# EasyEDA Pro project 小车PCB.epro

# Schematic Schematic1
Assembly Variant: Basic; Board Name: Board1; Create Date: 2026-04-20; Page Name: P1; Project Name: TI扩展板1; Schematic Name: Schematic1; Update Date: 2026-04-20; Company: 嘉立创EDA; Page Size: A4; Version: V1.0
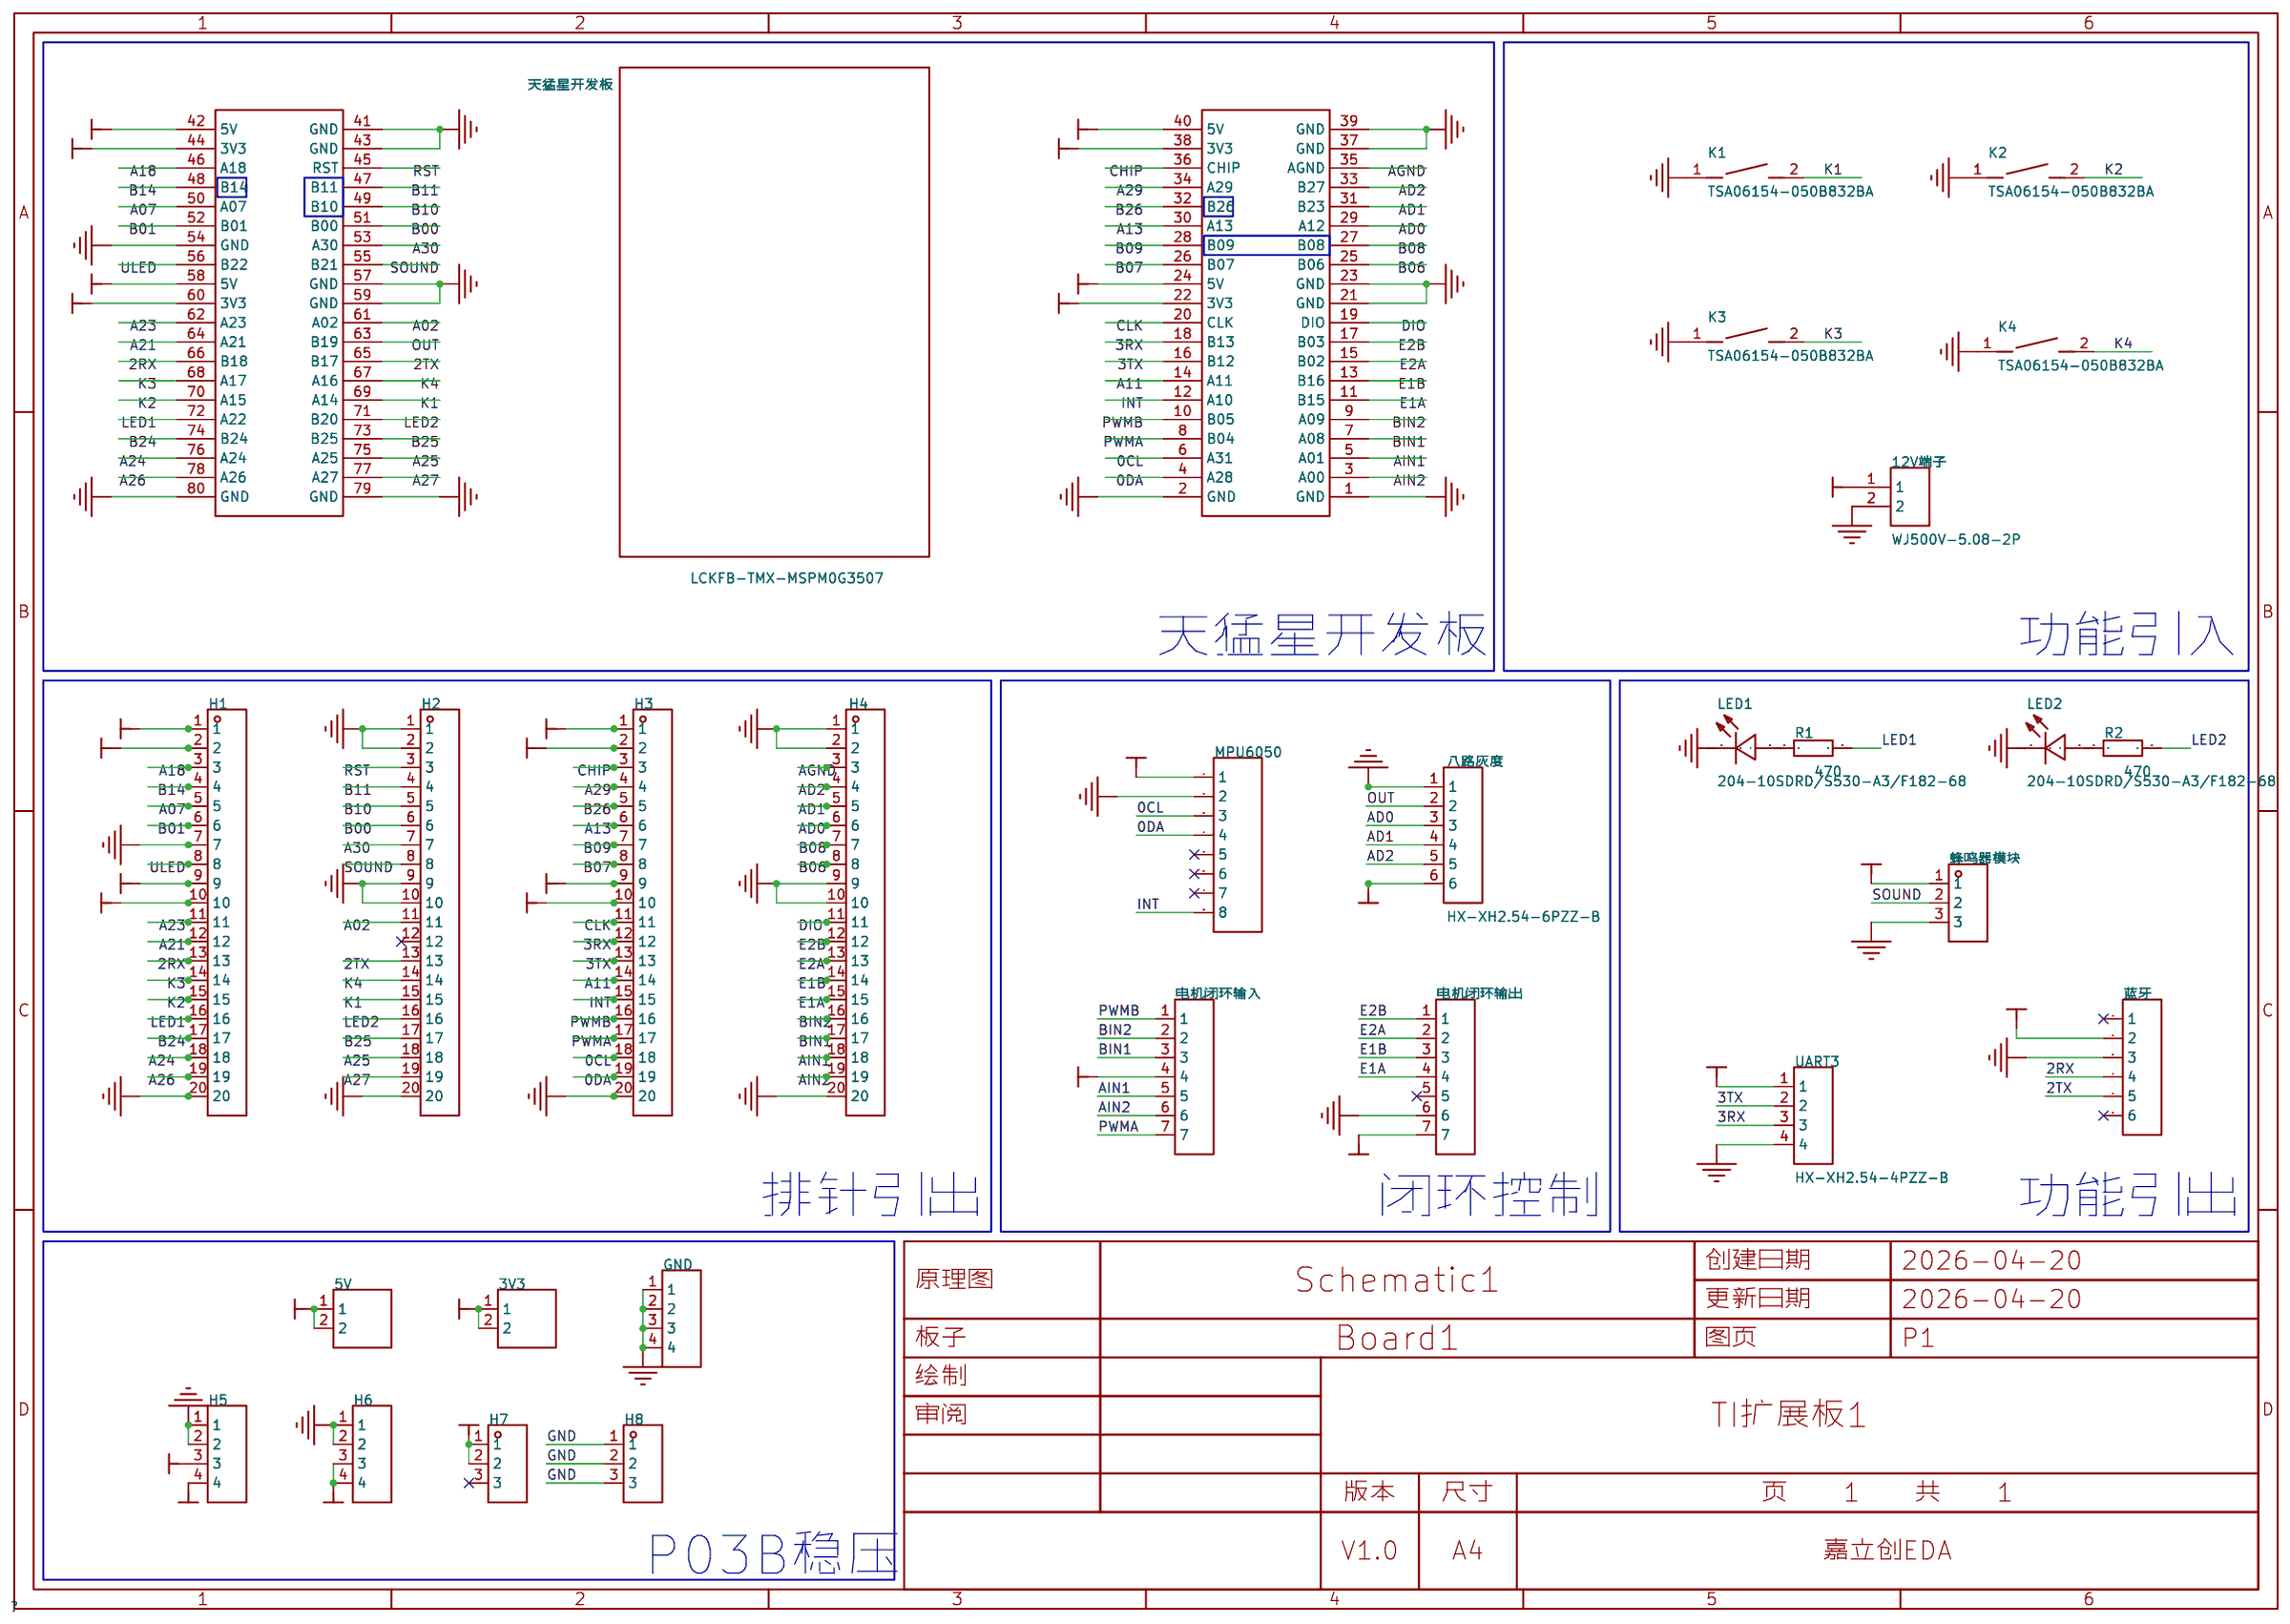
[diagram p0: schematic sheet]

## Parts
3V3  -  [HDR-TH_2P-P2.54-V-M-1]
5V  -  [HDR-TH_2P-P2.54-V-M-1]
12V端子  WJ500V-5.08-2P  [CONN-TH_2P-P5.00_WJ500V-5.08-2P]
GND  -  [HDR-TH_4P-P2.54-V-M]
H1  -  [HDR-TH_20P-P2.54-V-M-1]
H2  -  [HDR-TH_20P-P2.54-V-M-1]
H3  -  [HDR-TH_20P-P2.54-V-M-1]
H4  -  [HDR-TH_20P-P2.54-V-M-1]
H5  -  [HDR-TH_4P-P2.54-V-M]
H6  -  [HDR-TH_4P-P2.54-V-M]
H7  -  [HDR-TH_3P-P2.54-V-M]
H8  -  [HDR-TH_3P-P2.54-V-M]
K1  TSA06154-050B832BA  [SW-TH_L6.1-W6.1-P5.00]
K2  TSA06154-050B832BA  [SW-TH_L6.1-W6.1-P5.00]
K3  TSA06154-050B832BA  [SW-TH_L6.1-W6.1-P5.00]
K4  TSA06154-050B832BA  [SW-TH_L6.1-W6.1-P5.00]
LED1  204-10SDRD/S530-A3/F182-68  [LED-TH_BD4.0-P2.50-RD]
LED2  204-10SDRD/S530-A3/F182-68  [LED-TH_BD4.0-P2.50-RD]
MPU6050  -  [HDR-TH_8P-P2.54-V-M]
R1  470  [R0805]
R2  470  [R0805]
UART3  HX-XH2.54-4PZZ-B  [CONN-TH_4P-P2.5-HX-XH2.54-4PZZ-B]
八路灰度  HX-XH2.54-6PZZ-B  [CONN-TH_6P-P2.5-HX-XH2.54-6PZZ-B]
天猛星开发板  LCKFB-TMX-MSPM0G3507  [COMM-TH_LCKFB-TMX-MSPM0G3507]
电机闭环输入  -  [HDR-TH_7P-P2.54-V-M]
电机闭环输出  -  [HDR-TH_7P-P2.54-V-M]
蓝牙  -  [HDR-TH_6P-P2.54-V-M-1]
蜂鸣器模块  -  [HDR-TH_3P-P2.54-V-M]

## Library data of the parts
3V3 5V = HDR-M_2.54_1x2P: Supplier Part: C124375; Supplier Footprint: 插件
12V端子 = WJ500V-5.08-2P: 结构:1x2P;间距:5.08mm;颜色:绿色;安装方式:直插;额定电流:18A;额定电压:250V;排数:1;线规 - AWG:14~30;线规 - 平方毫米:2.5;每排PIN数:2;触头材质:-;触头镀层:-;工作温度范围:-40℃~+105℃;焊接温度(最大值):-;; LCSC Part Name: 1x2P 5.08mm 直插 排数:1 每排P数:2; Supplier Part: C8465; Manufacturer: KANGNEX(康奈克斯电气); Supplier Footprint: 插件,P=5.08mm; JLCPCB Part Class: Extended Part; Datasheet: https://atta.szlcsc.com/upload/public/pdf/source/20191225/C8465_02D34CE5B5B4A53DF5891601D97FA9F4.pdf; Supplier: LCSC; Structure: 1x2P; Pitch: 5.08mm; Color: 绿色; Mounting Style: 直插; Current Rating (Max): 18A; Voltage Rating (Max): 250V; Number of Pins: 2P; Number of Rows: 1; Wire Gauge - AWG: 14~30; Wire Gauge - mm2: 2.5; Number of PINs Per Row: 2; Operating Temperature Range: -40℃~+105℃; Screw Specification: M2.5
GND H5 H6 = HDR-M_2.54_1x4P: Supplier Part: C492403; Supplier Footprint: 插件
H1-H4 = HDR-M_2.54_1x20P: 间距:2.54mm;总PIN位数:20;排数:1;插针结构:-;行距:-;安装类型:直插;圆针/方针:-;额定电流:-;额定电压:-;配合针长度:-;塑高:-;触头材质:黄铜;触头镀层:-;颜色:黑色;; Supplier Part: C50981; Supplier Footprint: 插件
H7 H8 蜂鸣器模块 = HDR-M_2.54_1x3P: Supplier Part: C2937625; Supplier Footprint: 插件
K1-K4 = TSA06154-050B832BA: 6*6*5插件轻触开关、短两脚、脚长3.6mm、250gf、Fe盖、PA66黑柄; LCSC Part Name: 6*6*5短两脚轻触开关250gf; Supplier Part: C49174414; Manufacturer: Khon(康宏电子); Supplier Footprint: 插件,6.1x6.1mm; JLCPCB Part Class: Extended Part; Datasheet: https://item.szlcsc.com/datasheet/TSA06154-050B832BA/51568440.html; Supplier: LCSC
LED1 LED2 = 204-10SDRD/S530-A3/F182-68: Supplier Part: C473831; Manufacturer: EVERLIGHT(亿光); Supplier Footprint: 插件; JLCPCB Part Class: Extended Part; Supplier: LCSC
MPU6050 = HDR-M_2.54_1x8P: Supplier Part: C124381; Supplier Footprint: 插件
R1 R2 = Res_0805: Supplier Footprint: 0805
UART3 = HX-XH2.54-4PZZ-B: 插针结构:1x4P;间距:2.54mm;安装方式:直插;参考系列:XH;总PIN数:4P;排数:1;每排PIN数:4;行距:-;额定电流:3A;触头材质:黄铜;触头镀层:锡;工作温度:-25℃~+85℃;; LCSC Part Name: 1x4P 间距:2.54mm 直插 系列:XH; Supplier Part: C49010020; Manufacturer: hanxia(韩下); Supplier Footprint: 插件,P=2.5mm; JLCPCB Part Class: Extended Part; Datasheet: https://item.szlcsc.com/datasheet/HX-XH2.54-4PZZ-B/51365941.html; Supplier: LCSC; Pins Structure: 1x4P; Pitch: 2.54mm; Mounting Type: 直插; Reference Series: XH; Number of Pins: 4P; Number of Rows: 1; Number of PINs Per Row: 4; Current Rating: 3A; Contact Material: 黄铜; Contact Plating: 锡; Operating Temperature: -25℃~+85℃; Voltage Rating: 250V; Plastic Material: PA66; Flame Retardant Rating: UL94V-0; Color: 黑色
八路灰度 = HX-XH2.54-6PZZ-B: 插针结构:1x6P;间距:2.54mm;安装方式:直插;参考系列:XH;总PIN数:6P;排数:1;每排PIN数:6;行距:-;额定电流:3A;触头材质:黄铜;触头镀层:锡;工作温度:-25℃~+85℃;; LCSC Part Name: 1x6P 间距:2.54mm 直插 系列:XH; Supplier Part: C49010022; Manufacturer: hanxia(韩下); Supplier Footprint: 插件,P=2.5mm; JLCPCB Part Class: Extended Part; Datasheet: https://item.szlcsc.com/datasheet/HX-XH2.54-6PZZ-B/51365943.html; Supplier: LCSC; Pins Structure: 1x6P; Pitch: 2.54mm; Mounting Type: 直插; Reference Series: XH; Number of Pins: 6P; Number of Rows: 1; Number of PINs Per Row: 6; Current Rating: 3A; Contact Material: 黄铜; Contact Plating: 锡; Operating Temperature: -25℃~+85℃; Voltage Rating: 250V; Plastic Material: PA66; Flame Retardant Rating: UL94V-0; Color: 黑色
天猛星开发板 = LCKFB-TMX-MSPM0G3507: 该开发板板载德州仪器的微控制器核心,完美适配电赛指定TI芯片题目的要求。支持Keil、CCS和IAU等环境开发,搭配图形化代码生成工具,无需在意底层驱动,助力快速开发。硬件上带有多电源保护,防反接/防过流/受电压,和三路参考电压选择,降低电衰试错成本。80P引脚的引出方便扩展,提供完善的入门手册和模块移植案例。; LCSC Part Name: 5件套 立创·天猛星MSPM0G3507开发板; Supplier Part: C42378531; Manufacturer: 立创开发板; JLCPCB Part Class: Extended Part; Datasheet: https://item.szlcsc.com/datasheet/LCKFB-TMX-MSPM0G3507/44281600.html; Supplier: LCSC
电机闭环输入 电机闭环输出 = HDR-M_2.54_1x7P: Supplier Part: C492406; Supplier Footprint: 插件
蓝牙 = HDR-M_2.54_1x6P: Supplier Part: C37208; Supplier Footprint: 插件

## Nets
3V3: 3V3.1 3V3.2 H6.3 H6.4
5V: 5V.1 5V.2 H5.3
12V: 12V端子.1 H7.1 H7.2
+5V: H1.1 H1.9 H3.1 H3.9 H5.4 UART3.1 八路灰度.6 天猛星开发板.24(5V) 天猛星开发板.40(5V) 天猛星开发板.42(5V) 天猛星开发板.58(5V) 电机闭环输出.7 蜂鸣器模块.1
AGND: H4.3 天猛星开发板.35(AGND)
GND: 12V端子.2 GND.1 GND.2 GND.3 GND.4 H1.7 H1.20 H2.1 H2.2 H2.9 H2.10 H2.20 H3.20 H4.1 H4.2 H4.9 H4.10 H4.20 H5.1 H5.2 H6.1 H6.2 H8.1 H8.2 H8.3 K1.1 K2.1 K3.1 K4.1 LED1.1(C) LED2.1(C) MPU6050.2 UART3.4 八路灰度.1 天猛星开发板.1(GND) 天猛星开发板.2(GND) 天猛星开发板.21(GND) 天猛星开发板.23(GND) 天猛星开发板.37(GND) 天猛星开发板.39(GND) 天猛星开发板.41(GND) 天猛星开发板.43(GND) 天猛星开发板.54(GND) 天猛星开发板.57(GND) 天猛星开发板.59(GND) 天猛星开发板.79(GND) 天猛星开发板.80(GND) 电机闭环输出.6 蓝牙.3 蜂鸣器模块.3
VCC: H1.2 H1.10 H3.2 H3.10 MPU6050.1 天猛星开发板.22(3V3) 天猛星开发板.38(3V3) 天猛星开发板.44(3V3) 天猛星开发板.60(3V3) 电机闭环输入.4 蓝牙.2
0CL: H3.18 MPU6050.3 天猛星开发板.6(A31)
0DA: H3.19 MPU6050.4 天猛星开发板.4(A28)
2RX: H1.13 天猛星开发板.66(B18) 蓝牙.4
2TX: H2.13 天猛星开发板.65(B17) 蓝牙.5
3RX: H3.12 UART3.3 天猛星开发板.18(B13)
3TX: H3.13 UART3.2 天猛星开发板.16(B12)
A02: H2.11 天猛星开发板.61(A02)
A07: H1.5 天猛星开发板.50(A07)
A11: H3.14 天猛星开发板.14(A11)
A13: H3.6 天猛星开发板.30(A13)
A18: H1.3 天猛星开发板.46(A18)
A21: H1.12 天猛星开发板.64(A21)
A23: H1.11 天猛星开发板.62(A23)
A24: H1.18 天猛星开发板.76(A24)
A25: H2.18 天猛星开发板.75(A25)
A26: H1.19 天猛星开发板.78(A26)
A27: H2.19 天猛星开发板.77(A27)
A29: H3.4 天猛星开发板.34(A29)
A30: H2.7 天猛星开发板.53(A30)
AD0: H4.6 八路灰度.3 天猛星开发板.29(A12)
AD1: H4.5 八路灰度.4 天猛星开发板.31(B23)
AD2: H4.4 八路灰度.5 天猛星开发板.33(B27)
AIN1: H4.18 天猛星开发板.5(A01) 电机闭环输入.5
AIN2: H4.19 天猛星开发板.3(A00) 电机闭环输入.6
B00: H2.6 天猛星开发板.51(B00)
B01: H1.6 天猛星开发板.52(B01)
B06: H4.8 天猛星开发板.25(B06)
B07: H3.8 天猛星开发板.26(B07)
B08: H4.7 天猛星开发板.27(B08)
B09: H3.7 天猛星开发板.28(B09)
B10: H2.5 天猛星开发板.49(B10)
B11: H2.4 天猛星开发板.47(B11)
B14: H1.4 天猛星开发板.48(B14)
B24: H1.17 天猛星开发板.74(B24)
B25: H2.17 天猛星开发板.73(B25)
B26: H3.5 天猛星开发板.32(B26)
BIN1: H4.17 天猛星开发板.7(A08) 电机闭环输入.3
BIN2: H4.16 天猛星开发板.9(A09) 电机闭环输入.2
CHIP: H3.3 天猛星开发板.36(CHIP)
CLK: H3.11 天猛星开发板.20(CLK)
DIO: H4.11 天猛星开发板.19(DIO)
E1A: H4.15 天猛星开发板.11(B15) 电机闭环输出.4
E1B: H4.14 天猛星开发板.13(B16) 电机闭环输出.3
E2A: H4.13 天猛星开发板.15(B02) 电机闭环输出.2
E2B: H4.12 天猛星开发板.17(B03) 电机闭环输出.1
INT: H3.15 MPU6050.8 天猛星开发板.12(A10)
K1: H2.15 K1.2 天猛星开发板.69(A14)
K2: H1.15 K2.2 天猛星开发板.70(A15)
K3: H1.14 K3.2 天猛星开发板.68(A17)
K4: H2.14 K4.2 天猛星开发板.67(A16)
LED1: H1.16 R1.2 天猛星开发板.72(A22)
LED2: H2.16 R2.2 天猛星开发板.71(B20)
OUT: 八路灰度.2 天猛星开发板.63(B19)
PWMA: H3.17 天猛星开发板.8(B04) 电机闭环输入.7
PWMB: H3.16 天猛星开发板.10(B05) 电机闭环输入.1
RST: H2.3 天猛星开发板.45(RST)
SOUND: H2.8 天猛星开发板.55(B21) 蜂鸣器模块.2
ULED: H1.8 天猛星开发板.56(B22)
$1N365: LED2.2(A) R2.1
$1N366: LED1.2(A) R1.1

Not connected (* = marked no-connect by the designer): H2 12*; H7 3*; MPU6050 5* 6* 7*; 电机闭环输出 5*; 蓝牙 1* 6*

## Notes on the sheet
- 天猛星开发板
- 功能引入
- 排针引出
- 闭环控制
- 功能引出
- P03B稳压

# Board PCB1
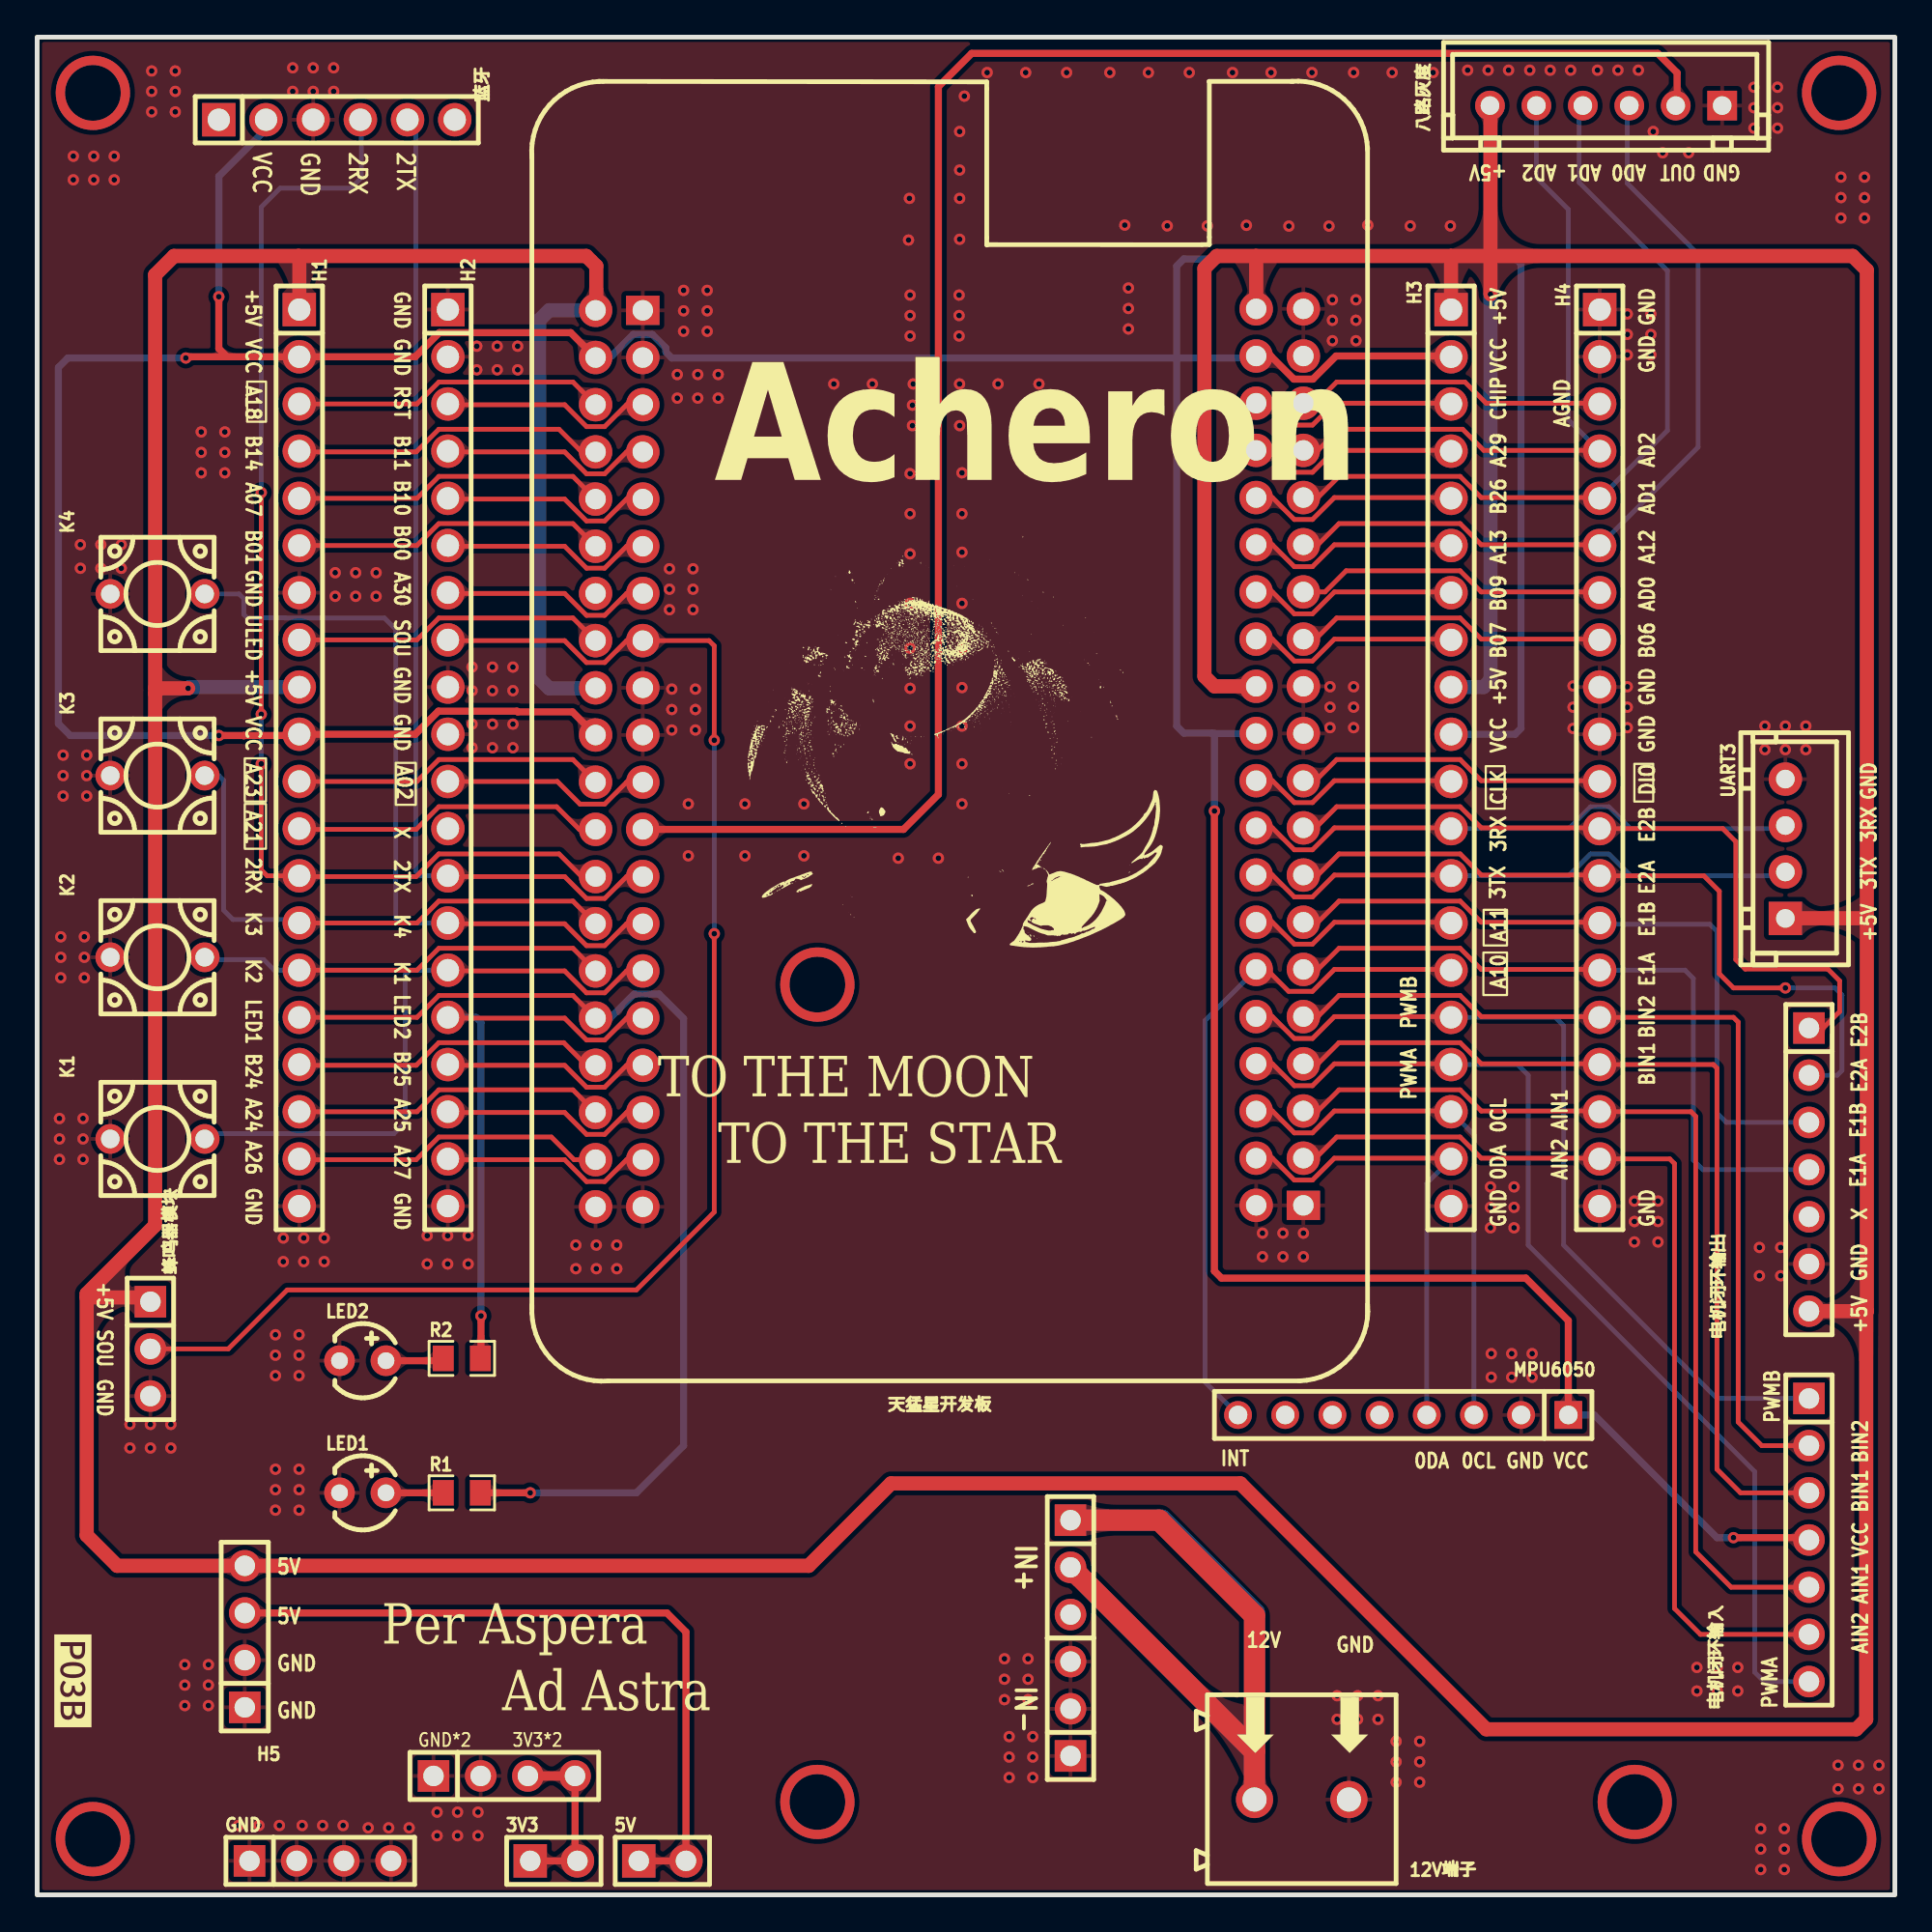
[diagram p1: board, top side]
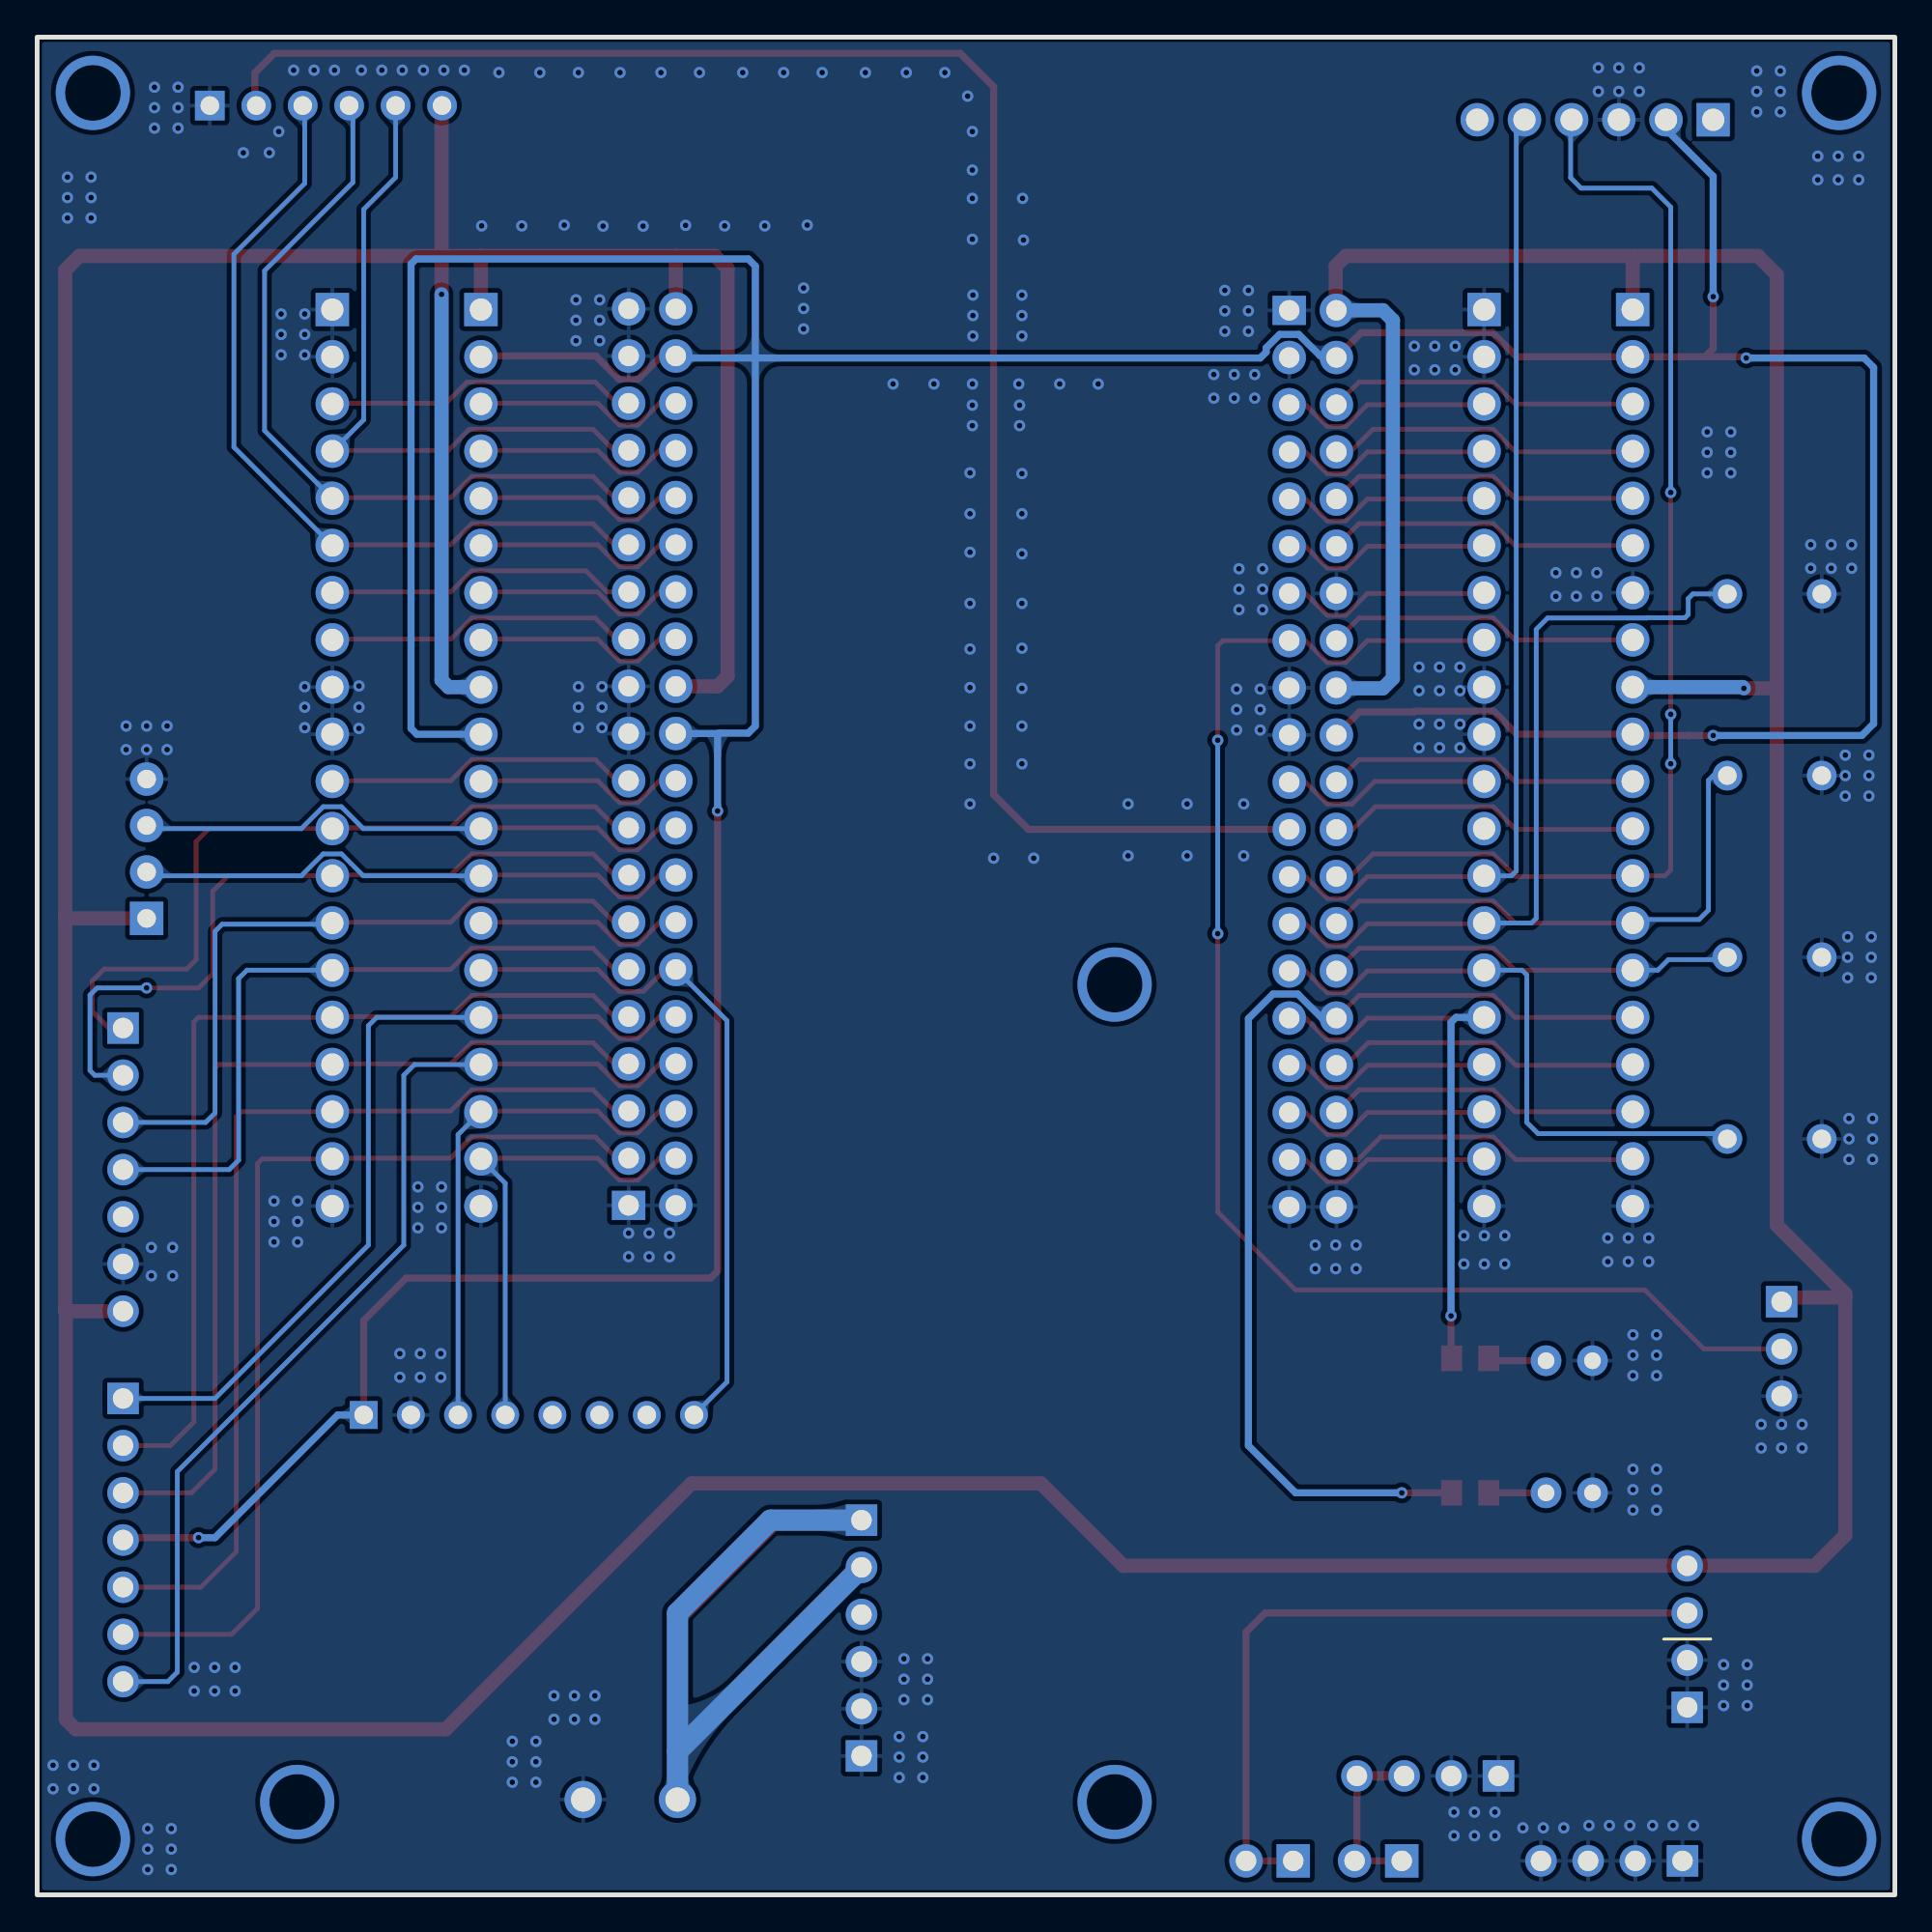
[diagram p2: board, bottom side, seen from below]

Outline 100 x 100 mm; copper layers: Top Layer, Bottom Layer. Coordinates in mm from the lower left corner of the outline.
Outline path: rectangle 0,100 100,0
Stack: Top Layer 0.035mm / Dielectric1 1.51mm FR4 er 4.5 / Bottom Layer 0.035mm

## Design rules (mm)
spacing copperThickness1oz (default): track to track 0.102, other pairs 0.152 to 0.3
spacing copperThickness2oz: track to track 0.203, other pairs 0.152 to 0.3
track width copperThickness1oz (default): min 0.127, default 0.254, max 2.54
track width copperThickness2oz: min 0.203, default 0.254, max 2.54
differential pair differentialPair (default): width min 0.127, default 0.254, max 2.54; gap min 0.152, default 0.152
net GND uses copperRegion

## Placement (name value [footprint] x y rotation side)
3V3  -  [HDR-TH_2P-P2.54-V-M-1]  27.81 1.83 0 top
5V  -  [HDR-TH_2P-P2.54-V-M-1]  33.66 1.83 0 top
12V端子  WJ500V-5.08-2P  [CONN-TH_2P-P5.00_WJ500V-5.08-2P]  68.07 5.13 0 top
GND  -  [HDR-TH_4P-P2.54-V-M]  15.24 1.83 0 top
H1  -  [HDR-TH_20P-P2.54-V-M-1]  14.11 61.2 270 top
H2  -  [HDR-TH_20P-P2.54-V-M-1]  22.11 61.2 270 top
H3  -  [HDR-TH_20P-P2.54-V-M-1]  76.11 61.2 270 top
H4  -  [HDR-TH_20P-P2.54-V-M-1]  84.11 61.21 270 top
H5  -  [HDR-TH_4P-P2.54-V-M]  11.18 13.9 90 top
H6  -  [HDR-TH_4P-P2.54-V-M]  25.15 6.4 0 top
H7  -  [HDR-TH_3P-P2.54-V-M]  55.63 17.63 270 top
H8  -  [HDR-TH_3P-P2.54-V-M]  55.63 10.02 90 top
K1  TSA06154-050B832BA  [SW-TH_L6.1-W6.1-P5.00]  6.48 40.69 0 top
K2  TSA06154-050B832BA  [SW-TH_L6.1-W6.1-P5.00]  6.48 50.47 0 top
K3  TSA06154-050B832BA  [SW-TH_L6.1-W6.1-P5.00]  6.48 60.25 0 top
K4  TSA06154-050B832BA  [SW-TH_L6.1-W6.1-P5.00]  6.48 70.03 0 top
LED1  204-10SDRD/S530-A3/F182-68  [LED-TH_BD4.0-P2.50-RD]  17.53 21.64 0 top
LED2  204-10SDRD/S530-A3/F182-68  [LED-TH_BD4.0-P2.50-RD]  17.53 28.75 0 top
MPU6050  -  [HDR-TH_8P-P2.54-V-M]  73.53 25.83 180 top
R1  470  [R0805]  22.86 21.64 0 top
R2  470  [R0805]  22.86 28.88 0 top
UART3  HX-XH2.54-4PZZ-B  [CONN-TH_4P-P2.5-HX-XH2.54-4PZZ-B]  94.11 56.31 270 top
八路灰度  HX-XH2.54-6PZZ-B  [CONN-TH_6P-P2.5-HX-XH2.54-6PZZ-B]  84.46 96.32 0 top
天猛星开发板  LCKFB-TMX-MSPM0G3507  [COMM-TH_LCKFB-TMX-MSPM0G3507]  49.11 61.2 180 top
电机闭环输入  -  [HDR-TH_7P-P2.54-V-M]  95.38 19.1 270 top
电机闭环输出  -  [HDR-TH_7P-P2.54-V-M]  95.38 39.04 270 top
蓝牙  -  [HDR-TH_6P-P2.54-V-M-1]  16.13 95.56 0 top
蜂鸣器模块  -  [HDR-TH_3P-P2.54-V-M]  6.1 29.39 270 top

## Footprints (pads in the part's own frame, mm; a bottom-side part is the same pattern mirrored in y, then rotated)
COMM-TH_LCKFB-TMX-MSPM0G3507
  rect 1.8x1.575 hole 1.1: 1(-19.05,24.09) 41(16.51,-24.09)
  round 1.8 hole 1.1: 2(-16.51,24.09) 3(-19.05,21.549) 4(-16.51,21.549) 5(-19.05,19.009) 6(-16.51,19.009) 7(-19.05,16.47) 8(-16.51,16.47) 9(-19.05,13.93) 10(-16.51,13.93) 11(-19.05,11.389) 12(-16.51,11.389) 13(-19.05,8.85) 14(-16.51,8.85) 15(-19.05,6.309) 16(-16.51,6.309) 17(-19.05,3.769) 18(-16.51,3.769) 19(-19.05,1.23) 20(-16.51,1.23) 21(-19.05,-1.31) 22(-16.51,-1.31) 23(-19.05,-3.85) 24(-16.51,-3.85) 25(-19.05,-6.391) 26(-16.51,-6.391) 27(-19.05,-8.931) 28(-16.51,-8.931) 29(-19.05,-11.47) 30(-16.51,-11.47) 31(-19.05,-14.011) 32(-16.51,-14.011) 33(-19.05,-16.55) 34(-16.51,-16.55) 35(-19.05,-19.09) 36(-16.51,-19.09) 37(-19.05,-21.631) 38(-16.51,-21.631) 39(-19.05,-24.171) 40(-16.51,-24.171) 42(19.05,-24.09) 43(16.51,-21.549) 44(19.05,-21.549) 45(16.51,-19.009) 46(19.05,-19.009) 47(16.51,-16.47) 48(19.05,-16.47) 49(16.51,-13.93) 50(19.05,-13.93) 51(16.51,-11.389) 52(19.05,-11.389) 53(16.51,-8.85) 54(19.05,-8.85) 55(16.51,-6.309) 56(19.05,-6.309) 57(16.51,-3.769) 58(19.05,-3.769) 59(16.51,-1.23) 60(19.05,-1.23) 61(16.51,1.31) 62(19.05,1.31) 63(16.51,3.85) 64(19.05,3.85) 65(16.51,6.391) 66(19.05,6.391) 67(16.51,8.931) 68(19.05,8.931) 69(16.51,11.47) 70(19.05,11.47) 71(16.51,14.011) 72(19.05,14.011) 73(16.51,16.55) 74(19.05,16.55) 75(16.51,19.09) 76(19.05,19.09) 77(16.51,21.631) 78(19.05,21.631) 79(16.51,24.171) 80(19.05,24.171)
CONN-TH_2P-P5.00_WJ500V-5.08-2P
  round 2 hole 1.3: 1(-2.54,0) 2(2.54,0)
CONN-TH_4P-P2.5-HX-XH2.54-4PZZ-B
  rect 1.8x1.8 hole 1: 1(3.75,0)
  round 1.8 hole 1: 2(1.25,0) 3(-1.25,0) 4(-3.75,0)
CONN-TH_6P-P2.5-HX-XH2.54-6PZZ-B
  rect 1.6x1.6 hole 1: 1(6.25,0)
  round 1.6 hole 1: 2(3.75,0) 3(1.25,0) 4(-1.25,0) 5(-3.75,0) 6(-6.25,0)
HDR-TH_2P-P2.54-V-M-1
  rect 1.8x1.8 hole 1.1: 1(-1.27,0)
  round 1.8 hole 1.1: 2(1.27,0)
HDR-TH_3P-P2.54-V-M
  rect 1.7x1.7 hole 1.1: 1(-2.54,0)
  round 1.7 hole 1.1: 2(0,0) 3(2.54,0)
HDR-TH_4P-P2.54-V-M
  rect 1.7x1.7 hole 1.1: 1(-3.81,0)
  round 1.7 hole 1.1: 2(-1.27,0) 3(1.27,0) 4(3.81,0)
HDR-TH_6P-P2.54-V-M-1
  rect 1.8x1.8 hole 1.2: 1(-6.35,0)
  round 1.8 hole 1.2: 2(-3.81,0) 3(-1.27,0) 4(1.27,0) 5(3.81,0) 6(6.35,0)
HDR-TH_7P-P2.54-V-M
  rect 1.7x1.7 hole 1.1: 1(-7.62,0)
  round 1.7 hole 1.1: 2(-5.08,0) 3(-2.54,0) 4(0,0) 5(2.54,0) 6(5.08,0) 7(7.62,0)
HDR-TH_8P-P2.54-V-M
  rect 1.5x1.5 hole 1: 1(-8.89,0)
  round 1.5 hole 1: 2(-6.35,0) 3(-3.81,0) 4(-1.27,0) 5(1.27,0) 6(3.81,0) 7(6.35,0) 8(8.89,0)
HDR-TH_20P-P2.54-V-M-1
  rect 1.8x1.8 hole 1.2: 1(-24.13,0)
  round 1.8 hole 1.2: 2(-21.59,0) 3(-19.05,0) 4(-16.51,0) 5(-13.97,0) 6(-11.43,0) 7(-8.89,0) 8(-6.35,0) 9(-3.81,0) 10(-1.27,0) 11(1.27,0) 12(3.81,0) 13(6.35,0) 14(8.89,0) 15(11.43,0) 16(13.97,0) 17(16.51,0) 18(19.05,0) 19(21.59,0) 20(24.13,0)
LED-TH_BD4.0-P2.50-RD
  round 1.651 hole 0.9: 1(-1.25,0) 2(1.25,0)
R0805
  rect 1.133x1.377 smd: 1(-1,0) 2(1,0)
SW-TH_L6.1-W6.1-P5.00
  round 1.6 hole 1: 1(-2.54,0) 2(2.54,0)

## Nets
As in the schematic.

Pads without a net: H2 12; H7 3; MPU6050 5 6 7; 电机闭环输出 5; 蓝牙 1 6

## Via types
v1: diameter 4, hole 3, Top Layer to Bottom Layer, 7 vias
v2: diameter 0.61, hole 0.305, Top Layer to Bottom Layer, 364 vias

## Routing (per net, layer and track width the routed paths; a pad name or vN(x,y) marks a point on that pad's centre or on a via; arc(x,y) is an arc through that point)
3V3: length 9.9
  Top Layer w0.381: 3V3.1 3V3.2 28.96,1.96 H6.4 ; 28.45,1.83 28.57,1.7
  Top Layer w0.508: H6.3 H6.4
5V: length 39
  Top Layer w0.381: 5V.2 34.93,14.15 33.9,15.17 H5.3 ; 34.8,1.7 34.67,1.83 5V.1
12V: length 72
  Top Layer w1.143: H7.2 65.53,7.72 ; 65.53,7.72 12V端子.1 ; 65.53,7.72 65.53,15.04 60.4,20.17 H7.1
  Bottom Layer w1.143: 65.53,7.72 65.53,15.16 60.53,20.17 H7.1 ; 65.53,7.72 12V端子.1 ; 65.53,7.72 H7.2
+5V: length 426
  Top Layer w0.762: 78.23,88.22 76.11,88.22 ; 78.23,88.22 78.23,96.29 八路灰度.6 ; 78.23,88.22 v2(78.23,86.16) ; 78.23,88.22 97.73,88.22 98.49,87.46 98.49,52.57 ; 76.11,88.22 65.62,88.22 ; 76.11,88.22 H3.1 ; 65.62,88.22 63.5,88.22 62.83,87.55 62.83,65.59 63.37,65.06 天猛星开发板.24 ; 65.62,88.22 天猛星开发板.40 ; 14.07,88.22 29.56,88.22 30.1,87.68 30.1,85.33 天猛星开发板.42 ; 14.07,88.22 7.37,88.22 6.35,87.2 6.35,64.95 6.6,64.95 ; 14.07,88.22 14.11,88.18 H1.1 ; 98.49,31.42 电机闭环输出.7 ; 98.49,31.42 98.46,31.39 98.46,9.45 97.92,8.91 78.01,8.91 64.77,22.15 45.97,22.15 41.53,17.71 H5.4 4.31,17.71 2.67,19.35 2.67,32.16 ; 98.49,31.42 98.49,52.57 ; 2.67,32.16 2.67,32.36 6.35,36.04 6.35,64.69 6.6,64.95 ; 2.67,32.16 5.86,32.16 蜂鸣器模块.1 ; 98.49,52.57 98.48,52.56 ; 98.49,52.57 94.11,52.57 ; 6.6,64.95 v2(8.13,64.95)
  Bottom Layer w0.762: 天猛星开发板.58 30.03,64.95 27.56,64.95 27.02,65.49 27.02,84.76 27.56,85.3 30.06,85.3 天猛星开发板.42 ; H3.9 77.86,65.02 78.23,65.39 v2(78.23,86.16) ; v2(8.13,64.95) 8.19,65.02 H1.9
AGND: length 16.9
  Top Layer w0.254: 天猛星开发板.35 68.81,80.3 69.95,81.43 76.86,81.43 78,80.3 84.07,80.3 H4.3
GND:
  vias: v2(1.2,41.79) v2(1.2,40.69) v2(1.2,39.59) v2(1.27,51.57) v2(1.27,50.47) v2(1.27,49.37) v2(1.4,61.35) v2(1.4,60.25) v2(1.4,59.15) v2(1.95,93.59) v2(1.95,92.32) v2(2.33,72.68) v2(2.33,71.41) v2(2.54,51.57) v2(2.54,50.47) v2(2.54,49.37) v2(2.47,41.79) v2(2.47,40.69) v2(2.47,39.59) v2(2.67,61.35) v2(2.67,60.25) v2(2.67,59.15) v2(3.05,93.59) v2(3.05,92.32) v2(3.43,72.68) v2(3.43,71.41) v2(4.15,93.59) v2(4.15,92.32) v2(4.53,72.68) v2(4.53,71.41) v2(5,25.32) v2(5,24.05) v2(6.1,25.32) v2(6.1,24.05) v2(6.17,98.18) v2(6.17,97.08) v2(6.17,95.98) v2(7.2,25.32) v2(7.2,24.05) v2(7.44,98.18) v2(7.44,97.08) v2(7.44,95.98) v2(7.95,12.39) v2(7.95,11.29) v2(7.95,10.19) v2(8.83,78.75) v2(8.83,77.65) v2(8.83,76.55) v2(9.22,12.39) v2(9.22,11.29) v2(9.22,10.19) v2(10.1,78.75) v2(10.1,77.65) v2(10.1,76.55) v2(10.84,3.73) v2(11.94,3.73) v2(12.83,30.15) v2(12.83,29.05) v2(12.83,27.95) v2(12.83,22.91) v2(12.83,21.81) v2(12.83,20.71) v2(13.04,3.73) v2(13.25,35.36) v2(13.25,34.09) v2(13.76,98.35) v2(13.76,97.08) v2(14.1,30.15) v2(14.1,29.05) v2(14.1,27.95) v2(14.1,22.91) v2(14.1,21.81) v2(14.1,20.71) v2(14.27,3.73) v2(14.35,35.36) v2(14.35,34.09) v2(14.86,98.35) v2(14.86,97.08) v2(15.37,3.73) v2(15.45,35.36) v2(15.45,34.09) v2(15.96,98.35) v2(15.96,97.08) v2(16.04,71.17) v2(16.04,69.9) v2(16.47,3.73) v2(17.14,71.17) v2(17.14,69.9) v2(17.82,3.61) v2(18.25,71.17) v2(18.25,69.9) v2(18.92,3.61) v2(20.02,3.61) v2(21,35.48) v2(21,33.96) v2(21.53,4.45) v2(21.53,3.18) v2(22.1,35.48) v2(22.1,33.96) v2(22.63,4.45) v2(22.63,3.18) v2(23.2,35.48) v2(23.2,33.96) v2(23.41,66.09) v2(23.41,64.82) v2(23.41,63.02) v2(23.41,61.75) v2(23.66,83.36) v2(23.66,82.09) v2(23.73,4.45) v2(23.73,3.18) v2(24.51,66.09) v2(24.51,64.82) v2(24.51,63.02) v2(24.51,61.75) v2(24.77,83.36) v2(24.77,82.09) v2(25.61,66.09) v2(25.61,64.82) v2(25.61,63.02) v2(25.61,61.75) v2(25.87,83.36) v2(25.87,82.09) v2(29,34.98) v2(29,33.71) v2(30.1,34.98) v2(30.1,33.71) v2(31.2,34.98) v2(31.2,33.71) v2(34.04,71.38) v2(34.04,70.28) v2(34.04,69.18) v2(34.16,64.91) v2(34.16,63.81) v2(34.16,62.7) v2(34.46,81.84) v2(34.46,80.57) v2(34.8,86.37) v2(34.8,85.27) v2(34.8,84.17) v2(35.05,58.72) v2(35.05,55.93) v2(35.31,71.38) v2(35.31,70.28) v2(35.31,69.18) v2(35.43,64.91) v2(35.43,63.81) v2(35.43,62.7) v2(35.56,81.84) v2(35.56,80.57) v2(36.07,86.37) v2(36.07,85.27) v2(36.07,84.17) v2(36.66,81.84) v2(36.66,80.57) v2(38.1,58.72) v2(38.1,55.93) v2(41.28,58.72) v2(41.28,55.93) v2(42.88,81.33) v2(44.96,81.33) v2(46.35,55.8) v2(46.91,89.08) v2(46.95,91.32) v2(46.99,86.11) v2(46.99,85.01) v2(46.99,83.91) v2(46.99,76.5) v2(46.99,74.35) v2(46.99,72.19) v2(46.99,69.52) v2(46.99,67.11) v2(46.99,64.95) v2(46.99,62.92) v2(46.99,60.88) v2(47.12,80.19) v2(47.12,79.09) v2(47.16,81.33) v2(48.51,55.8) v2(49.63,86.11) v2(49.63,85.01) v2(49.63,83.91) v2(49.66,94.92) v2(49.66,92.85) v2(49.66,91.32) v2(49.66,89.12) v2(49.65,81.33) v2(49.66,80.19) v2(49.66,79.09) v2(49.78,76.55) v2(49.78,74.35) v2(49.78,72.27) v2(49.78,69.52) v2(49.78,67.06) v2(49.78,64.99) v2(49.78,62.92) v2(49.78,60.88) v2(49.78,58.72) v2(49.91,96.83) v2(51.14,98.09) v2(51.73,81.33) v2(52.07,12.71) v2(52.07,11.61) v2(52.07,10.51) v2(52.32,8.52) v2(52.32,7.42) v2(52.32,6.32) v2(53.21,98.09) v2(53.34,12.71) v2(53.34,11.61) v2(53.34,10.51) v2(53.59,8.52) v2(53.59,7.42) v2(53.59,6.32) v2(53.93,81.33) v2(55.41,98.09) v2(57.74,98.09) v2(58.55,89.88) v2(58.74,86.5) v2(58.74,85.39) v2(58.74,84.29) v2(59.82,98.09) v2(60.83,89.84) v2(62.02,98.09) v2(62.99,89.84) v2(64.35,98.09) v2(65.09,89.87) v2(65.96,35.62) v2(65.96,34.35) v2(66.42,98.09) v2(67.06,35.62) v2(67.06,34.35) v2(67.38,89.83) v2(68.16,35.62) v2(68.16,34.35) v2(68.62,98.09) v2(69.54,89.83) v2(69.6,65.03) v2(69.6,63.93) v2(69.6,62.83) v2(69.72,85.86) v2(69.72,84.76) v2(69.72,83.66) v2(69.98,10.72) v2(69.98,9.45) v2(70.87,98.09) v2(70.87,65.03) v2(70.87,63.93) v2(70.87,62.83) v2(70.99,85.86) v2(70.99,84.76) v2(70.99,83.66) v2(71.08,10.72) v2(71.08,9.45) v2(71.63,89.88) v2(72.18,10.72) v2(72.18,9.45) v2(72.94,98.09) v2(73.15,8.26) v2(73.15,7.16) v2(73.15,6.06) v2(73.91,89.84) v2(74.42,8.26) v2(74.42,7.16) v2(74.42,6.06) v2(75.14,98.09) v2(76.07,89.84) v2(77,98.22) v2(78.1,98.22) v2(78.23,38.11) v2(78.23,37.01) v2(78.23,35.91) v2(78.27,29.13) v2(78.27,27.86) v2(79.21,98.22) v2(79.38,29.13) v2(79.38,27.86) v2(79.5,38.11) v2(79.5,37.01) v2(79.5,35.91) v2(80.35,98.22) v2(80.48,29.13) v2(80.48,27.86) v2(81.45,98.22) v2(82.55,98.22) v2(82.68,65.08) v2(82.68,63.93) v2(82.68,62.79) v2(83.99,98.22) v2(85.09,98.22) v2(85.6,85.1) v2(85.6,84) v2(85.6,82.9) v2(85.6,65.03) v2(85.6,63.93) v2(85.6,62.83) v2(85.98,37.35) v2(85.98,36.25) v2(85.98,35.14) v2(86.19,98.22) v2(86.87,85.1) v2(86.87,84) v2(86.87,82.9) v2(87,94.92) v2(87.25,37.35) v2(87.25,36.25) v2(87.25,35.14) v2(87.5,93.78) v2(88.9,93.78) v2(89.34,12.24) v2(89.34,10.97) v2(90.44,12.24) v2(90.44,10.97) v2(91.55,12.24) v2(91.55,10.97) v2(92.41,97.3) v2(92.41,96.2) v2(92.41,95.1) v2(92.71,34.85) v2(92.71,33.33) v2(92.78,3.56) v2(92.78,2.46) v2(92.78,1.36) v2(93.01,62.92) v2(93.01,61.65) v2(93.68,97.3) v2(93.68,96.2) v2(93.68,95.1) v2(93.85,34.85) v2(93.85,33.33) v2(94.05,3.56) v2(94.05,2.46) v2(94.05,1.36) v2(94.11,62.92) v2(94.11,61.65) v2(95.21,62.92) v2(95.21,61.65) v2(96.94,6.98) v2(96.94,5.71) v2(97.1,92.47) v2(97.1,91.36) v2(97.1,90.26) v2(98.04,6.98) v2(98.04,5.71) v2(98.37,92.47) v2(98.37,91.36) v2(98.37,90.26) v2(99.15,6.98) v2(99.15,5.71)
VCC: length 289
  Top Layer w0.381: 天猛星开发板.60 28.82,63.68 25.87,63.68 25.83,63.72 21.6,63.72 20.35,62.47 H1.10 14.04,62.41 11.14,62.41 11.13,62.39 11.11,62.41 v2(9.78,62.41) ; 天猛星开发板.44 28.72,84.09 21.65,84.09 20.35,82.8 H1.2 10.22,82.8 ; v2(9.78,86.03) 9.78,83.24 10.22,82.8 ; H3.2 76.07,82.84 69.92,82.84 68.68,81.59 67.65,81.59 66.4,82.84 天猛星开发板.38 ; 电机闭环输入.4 95.25,19.23 v2(91.31,19.23) ; 10.22,82.8 8.07,82.8 v2(8,82.73) ; v2(63.37,58.34) 63.37,33.58 63.75,33.2 80.14,33.2 82.42,30.91 MPU6050.1
  Bottom Layer w0.381: MPU6050.1 83.82,25.83 90.42,19.23 v2(91.31,19.23) ; 天猛星开发板.22 63.37,62.52 ; 63.37,62.52 v2(63.37,58.34) ; 63.37,62.52 63.27,62.52 63.25,62.53 61.72,62.53 61.34,62.92 61.34,82.73 ; 61.34,82.73 61.34,87.68 61.72,88.06 79.6,88.06 79.87,87.79 79.87,62.79 79.56,62.47 H3.10 ; 61.34,82.73 65.73,82.73 天猛星开发板.38 ; 61.34,82.73 34.16,82.73 33.84,83.05 33.84,83.27 33.12,84 32.09,84 30.94,82.86 30.16,82.86 天猛星开发板.44 ; v2(9.78,62.41) 1.78,62.41 1.14,63.04 1.14,82.22 1.65,82.73 v2(8,82.73) ; v2(9.78,86.03) 9.78,92.51 12.32,95.05 蓝牙.2
(no net):
  vias: v1(3,97) v1(3,3) v1(42,49) v1(42,5) v1(86,5) v1(97,97) v1(97,3)
0CL: length 28.3
  Top Layer w0.254: H3.18 76.07,42.2 69.83,42.2 68.65,41.02 67.67,41.02 66.49,42.2 天猛星开发板.6
  Bottom Layer w0.254: H3.18 77.34,40.92 MPU6050.3
0DA: length 25.8
  Top Layer w0.254: H3.19 76.07,39.66 69.83,39.66 68.65,38.48 67.67,38.48 66.49,39.66 天猛星开发板.4
  Bottom Layer w0.254: H3.19 74.8,38.31 MPU6050.4
2RX: length 64
  Top Layer w0.254: v2(12.06,63.55) v2(12.06,75.49) ; 天猛星开发板.66 29.31,54.81 28.09,56.03 21.62,56.03 20.4,54.81 14.15,54.81 H1.13 12.38,54.86 12.06,55.17 v2(12.06,60.88)
  Bottom Layer w0.254: v2(12.06,75.49) 12.06,90.86 13.08,91.87 16.89,91.87 17.45,92.43 17.45,95.5 蓝牙.4 ; v2(12.06,60.88) v2(12.06,63.55)
2TX: length 53.9
  Top Layer w0.254: H2.13 22.15,54.81 28.39,54.81 29.57,53.64 30.55,53.64 31.73,54.81 天猛星开发板.65
  Bottom Layer w0.254: H2.13 20.63,54.86 20.38,55.11 20.38,95.11 蓝牙.5
3RX: length 30.5
  Top Layer w0.254: H3.12 76.07,57.44 69.83,57.44 68.65,56.26 67.67,56.26 66.49,57.44 天猛星开发板.18
  Bottom Layer w0.254: UART3.3 93.94,57.39 85.78,57.39 84.6,58.57 83.62,58.57 82.44,57.39 H3.12
3TX: length 30.5
  Top Layer w0.254: H3.13 76.07,54.9 69.83,54.9 68.65,53.72 67.67,53.72 66.49,54.9 天猛星开发板.16
  Bottom Layer w0.254: UART3.2 93.9,54.86 85.78,54.86 84.6,56.03 83.62,56.03 82.44,54.86 H3.13
A02: length 11.5
  Top Layer w0.254: H2.11 28,59.94 29.22,58.72 30.55,58.72 31.73,59.89 天猛星开发板.61
A07: length 16.9
  Top Layer w0.254: 天猛星开发板.50 28.84,76.35 21.62,76.35 20.44,75.17 H1.5
A11: length 11.5
  Top Layer w0.254: 天猛星开发板.14 66.49,52.36 67.67,51.18 68.65,51.18 69.83,52.36 76.07,52.36 H3.14
A13: length 11.5
  Top Layer w0.254: 76.11,72.64 76.07,72.68 69.83,72.68 68.65,71.5 67.67,71.5 66.49,72.68 天猛星开发板.30
A18: length 16.9
  Top Layer w0.254: H1.3 20.44,80.25 21.62,81.43 28.84,81.43 天猛星开发板.46
A21: length 17
  Top Layer w0.254: H1.12 14.15,57.35 20.4,57.35 21.62,58.57 27.96,58.57 29.18,57.35 天猛星开发板.64
A23: length 16.9
  Top Layer w0.254: 天猛星开发板.62 28.84,61.11 21.62,61.11 20.44,59.94 H1.11
A24: length 16.9
  Top Layer w0.254: H1.18 20.44,42.16 21.62,43.33 28.84,43.33 天猛星开发板.76
A25: length 11.5
  Top Layer w0.254: H2.18 22.15,42.11 28.39,42.11 29.57,40.94 30.55,40.94 31.73,42.11 天猛星开发板.75
A26: length 17
  Top Layer w0.254: 天猛星开发板.78 28.9,39.57 27.68,40.79 21.62,40.79 20.4,39.57 14.15,39.57 H1.19
A27: length 11.5
  Top Layer w0.254: 天猛星开发板.77 31.73,39.57 30.55,38.4 29.57,38.4 28.39,39.57 22.15,39.57 H2.19
A29: length 11.5
  Top Layer w0.254: H3.4 76.07,77.76 69.83,77.76 68.65,76.58 67.67,76.58 66.49,77.76 天猛星开发板.34
A30: length 11.5
  Top Layer w0.254: H2.7 22.15,70.05 28.39,70.05 29.57,68.88 30.55,68.88 31.73,70.05 天猛星开发板.53
AD0: length 44.4
  Top Layer w0.254: H4.6 84.07,72.68 77.74,72.68 76.6,73.81 70.08,73.81 68.94,72.68 天猛星开发板.29
  Bottom Layer w0.254: H4.6 89.41,77.93 89.41,88.32 85.6,92.13 85.6,96.21 八路灰度.3
AD1: length 41.6
  Top Layer w0.254: H4.5 84.07,75.22 77.74,75.22 76.6,76.35 70.08,76.35 68.94,75.22 天猛星开发板.31
  Bottom Layer w0.254: H4.5 87.76,78.82 87.76,87.43 83.01,92.18 83.01,96.12 八路灰度.4
AD2: length 36.9
  Top Layer w0.254: H4.4 84.07,77.76 77.87,77.76 76.73,78.89 70.08,78.89 68.94,77.76 天猛星开发板.33
  Bottom Layer w0.254: 八路灰度.5 80.71,92.45 82.42,90.73 82.42,79.4 H4.4
AIN1: length 52.5
  Top Layer w0.254: 天猛星开发板.5 68.94,42.2 70.08,43.33 76.6,43.33 77.74,42.2 84.07,42.2 H4.18 89.03,42.16 89.28,41.9 89.28,18.47 91.19,16.56 电机闭环输入.5
AIN2: length 52.8
  Top Layer w0.254: 天猛星开发板.3 68.81,39.66 69.95,40.79 76.6,40.79 77.74,39.66 84.07,39.66 H4.19 87.88,39.62 88.14,39.36 88.14,15.42 89.53,14.02 电机闭环输入.6
B00: length 11.5
  Top Layer w0.254: 22.11,72.64 22.15,72.59 28.39,72.59 29.57,71.42 30.55,71.42 31.73,72.59 天猛星开发板.51
B01: length 16.9
  Top Layer w0.254: 天猛星开发板.52 28.84,73.81 21.62,73.81 20.44,72.64 14.11,72.64
B06: length 16.9
  Top Layer w0.254: H4.8 84.07,67.6 77.74,67.6 76.6,68.73 69.95,68.73 68.81,67.6 天猛星开发板.25
B07: length 11.5
  Top Layer w0.254: 天猛星开发板.26 66.49,67.6 67.67,66.42 68.65,66.42 69.83,67.6 76.07,67.6 76.11,67.56
B08: length 16.9
  Top Layer w0.254: H4.7 84.07,70.14 77.74,70.14 76.6,71.27 70.46,71.27 69.32,70.14 天猛星开发板.27
B09: length 11.5
  Top Layer w0.254: H3.7 76.07,70.14 69.83,70.14 68.65,68.96 67.67,68.96 66.49,70.14 天猛星开发板.28
B10: length 11.5
  Top Layer w0.254: H2.5 22.15,75.13 28.39,75.13 29.57,73.96 30.55,73.96 31.73,75.13 天猛星开发板.49
B11: length 11.5
  Top Layer w0.254: H2.4 22.15,77.67 28.39,77.67 29.57,76.5 30.55,76.5 31.73,77.67 天猛星开发板.47
B14: length 17
  Top Layer w0.254: H1.4 14.15,77.67 20.4,77.67 21.62,78.89 28.09,78.89 29.31,77.67 天猛星开发板.48
B24: length 17
  Top Layer w0.254: 天猛星开发板.74 29.56,44.65 28.34,45.87 21.62,45.87 20.4,44.65 14.15,44.65 H1.17
B25: length 11.5
  Top Layer w0.254: 天猛星开发板.73 31.73,44.65 30.55,43.48 29.57,43.48 28.39,44.65 22.15,44.65 H2.17
B26: length 11.5
  Top Layer w0.254: 天猛星开发板.32 66.49,75.22 67.67,74.04 68.65,74.04 69.83,75.22 76.07,75.22 H3.5
BIN1: length 50.4
  Top Layer w0.254: 电机闭环输入.3 91.69,21.64 90.42,22.91 90.42,44.5 90.23,44.7 H4.17 84.07,44.74 77.74,44.74 76.6,45.87 70.08,45.87 68.94,44.74 天猛星开发板.7
BIN2: length 50.3
  Top Layer w0.254: 天猛星开发板.9 68.94,47.28 70.08,48.41 76.6,48.41 77.74,47.28 84.07,47.28 H4.16 91.31,47.24 91.57,46.98 91.57,25.45 92.84,24.18 电机闭环输入.2
CHIP: length 11.5
  Top Layer w0.254: 天猛星开发板.36 66.49,80.3 67.67,79.12 68.65,79.12 69.83,80.3 76.07,80.3 H3.3
CLK: length 11.5
  Top Layer w0.254: 天猛星开发板.20 66.49,59.98 67.67,58.8 68.65,58.8 69.83,59.98 76.07,59.98 H3.11
DIO: length 16.9
  Top Layer w0.254: 天猛星开发板.19 68.81,59.98 69.95,61.11 76.6,61.11 77.74,59.98 84.07,59.98 H4.11
E1A: length 38.4
  Top Layer w0.254: 天猛星开发板.11 68.94,49.82 70.08,50.95 76.6,50.95 77.74,49.82 84.07,49.82 H4.15
  Bottom Layer w0.254: H4.15 88.71,49.78 89.15,49.33 89.15,39.55 89.66,39.04 电机闭环输出.4
E1B: length 38.4
  Top Layer w0.254: H4.14 84.07,52.36 77.74,52.36 76.6,53.49 70.08,53.49 68.94,52.36 天猛星开发板.13
  Bottom Layer w0.254: H4.14 84.18,52.25 90.04,52.25 90.42,51.87 90.42,42.09 90.93,41.58 电机闭环输出.3
E2A: length 41.2
  Top Layer w0.254: v2(94.11,48.82) 91.31,48.82 90.55,49.58 90.55,54.03 89.72,54.86 H4.13 84.07,54.9 77.74,54.9 76.6,56.03 70.08,56.03 68.94,54.9 天猛星开发板.15
  Bottom Layer w0.254: 电机闭环输出.2 96.9,44.12 97.16,44.37 97.16,48.44 96.77,48.82 v2(94.11,48.82)
E2B: length 40.6
  Top Layer w0.254: 电机闭环输出.1 96.14,46.66 97.03,47.55 97.03,49.2 96.39,49.83 91.95,49.83 91.44,50.34 91.44,56.69 90.74,57.4 H4.12 84.07,57.44 77.74,57.44 76.6,58.57 69.95,58.57 68.81,57.44 天猛星开发板.17
INT: length 37.3
  Top Layer w0.254: H3.15 76.07,49.82 69.83,49.82 68.65,48.64 67.37,48.64 66.19,49.82 天猛星开发板.12
  Bottom Layer w0.254: 天猛星开发板.12 62.87,47.06 62.87,27.61 64.64,25.83
K1: length 33
  Top Layer w0.254: H2.15 22.15,49.73 28.39,49.73 29.57,48.56 30.55,48.56 31.73,49.73 天猛星开发板.69
  Bottom Layer w0.254: 9.02,40.69 9.3,40.98 19.21,40.98 19.81,41.58 19.81,49.52 20.07,49.78 H2.15
K2: length 22.3
  Top Layer w0.254: 天猛星开发板.70 28.84,50.95 21.62,50.95 20.44,49.78 H1.15
  Bottom Layer w0.254: H1.15 12.76,49.78 12.19,50.34 9.14,50.34 9.02,50.47
K3: length 29.4
  Top Layer w0.254: 天猛星开发板.68 28.84,53.49 21.62,53.49 20.44,52.31 H1.14
  Bottom Layer w0.254: H1.14 13.92,52.5 10.54,52.5 10.03,53.01 10.03,60 9.78,60.25 9.02,60.25
K4: length 41.5
  Top Layer w0.254: 天猛星开发板.67 31.73,52.27 30.55,51.1 29.57,51.1 28.39,52.27 22.15,52.27 H2.14
  Bottom Layer w0.254: H2.14 19.56,52.31 19.3,52.57 19.3,68.12 18.69,68.73 13.34,68.73 13.32,68.75 11.3,68.75 11.12,68.93 11.12,69.77 10.87,70.03 9.02,70.03
LED1: length 57.7
  Top Layer w0.254: H1.16 20.44,47.23 21.62,48.41 28.84,48.41 天猛星开发板.72
  Top Layer w0.381: v2(26.54,21.64) R1.2
  Bottom Layer w0.381: v2(26.54,21.64) 32.26,21.64 34.8,24.18 34.8,47.17 33.47,48.49 32.14,48.49 30.84,47.19 天猛星开发板.72
LED2: length 31.5
  Top Layer w0.254: H2.16 22.15,47.19 28.39,47.19 29.57,46.02 30.55,46.02 31.73,47.19 天猛星开发板.71
  Top Layer w0.381: R2.2 23.89,28.91 v2(23.89,31.17)
  Bottom Layer w0.381: v2(23.89,31.17) 23.89,46.97 23.62,47.23 H2.16
OUT: length 97.5
  Top Layer w0.381: 八路灰度.2 88.28,96.39 88.28,98.08 87.23,99.13 50.31,99.13 48.51,97.33 48.51,59.23 46.64,57.35 天猛星开发板.63
PWMA: length 56.2
  Top Layer w0.254: H3.17 76.07,44.74 69.83,44.74 68.65,43.56 67.67,43.56 66.49,44.74 天猛星开发板.8
  Bottom Layer w0.254: H3.17 79.69,44.69 80.26,44.12 80.26,34.98 92.46,22.78 92.46,11.99 92.96,11.48 电机闭环输入.7
PWMB: length 46.2
  Top Layer w0.254: 天猛星开发板.10 66.49,47.28 67.67,46.1 68.65,46.1 69.83,47.28 76.07,47.28 H3.16
  Bottom Layer w0.254: 电机闭环输入.1 90.42,26.72 82.17,34.98 82.17,46.79 81.72,47.23 H3.16
RST: length 11.5
  Top Layer w0.254: 天猛星开发板.45 31.73,80.21 30.55,79.04 29.57,79.04 28.39,80.21 22.15,80.21 H2.3
SOUND: length 79.3
  Top Layer w0.254: 22.11,67.56 22.15,67.51 28.39,67.51 29.57,66.34 30.55,66.34 31.73,67.51 天猛星开发板.55 36.17,67.51 36.45,67.23 v2(36.45,62.15) ; v2(36.45,51.74) 36.45,36.75 32.26,32.56 13.46,32.56 10.29,29.39 蜂鸣器模块.2
  Bottom Layer w0.254: v2(36.45,62.15) v2(36.45,51.74)
ULED: length 16.9
  Top Layer w0.254: 14.11,67.56 20.44,67.56 21.62,68.73 28.84,68.73 天猛星开发板.56
$1N365: length 3.1
  Top Layer w0.381: R2.1 21.73,28.75 LED2.2
$1N366: length 3.1
  Top Layer w0.381: R1.1 LED1.2

## Copper pours and planes (outline as drawn; the poured copper is in the pictures)
GND on Top Layer: -4.44,103.3 104.14,103.3 104.14,-3.12 -4.44,-3.12
GND on Bottom Layer: -2.92,102.16 103.25,102.16 103.25,-3.12 -2.92,-3.12

Small or netless copper shapes (teardrops, artwork), in the pictures only: 201 on Top Layer, 68 on Bottom Layer

## Text on the board
Top Silkscreen Layer: GND*2 | 3V3*2 | INT | 12V | GND | 0DA | 0CL | VCC | PWMB | PWMA | 3TX | +5V | CHIP | A29 | B26 | A13 | B09 | B07 | CLK | 3RX | A11 | A10 | AIN1 | AIN2 | AGND | AD2 | AD1 | A12 | AD0 | B06 | DIO | E2B | E2A | E1B | E1A | BIN2 | BIN1 | X | OUT | SOU | A18 | B14 | A07 | B01 | ULED | A23 | A21 | 2RX | K3 | K2 | LED1 | B24 | A24 | A26 | RST | B11 | B10 | B00 | A30 | 2TX | K4 | K1 | LED2 | B25 | A25 | A27 | A02 | 5V | IN+ | IN- | Acheron | Per Aspera / Ad Astra | TO THE MOON / TO THE STAR

# Board 封装文件
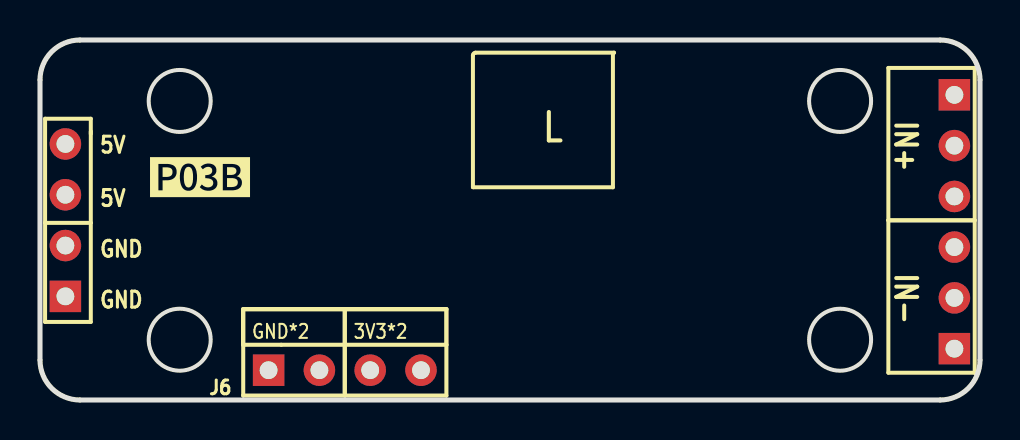
[diagram p3: board, top side]
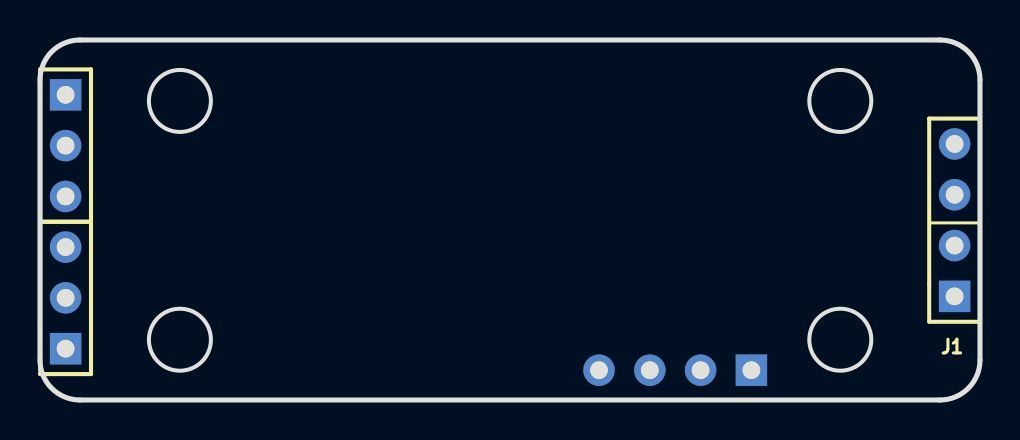
[diagram p4: board, bottom side, seen from below]

Outline 47 x 18 mm; copper layers: Top Layer, GND, PWR, Bottom Layer. Coordinates in mm from the lower left corner of the outline.
Outline path: circle c6.98,14.95 r1.55 ; circle c6.98,3.01 r1.55 ; circle c40,14.95 r1.55 ; circle c40,3.01 r1.55 ; 0,16 arc(0.59,17.41) 2,18 45,18 arc(46.41,17.41) 47,16 47,2 arc(46.41,0.59) 45,0 2,0 arc(0.59,0.59) 0,2 0,16
Stack: Top Layer 0.035mm / Bottom Layer 0.035mm

## Design rules (mm)
spacing Default (default): track to track 0.102, other pairs 0 to 0.3
track width Default (default): min 0.25, default 0.25, max 25.4
differential pair differentialPair (default): width min 0.127, default 2.54, max 2.54; gap min 0.127, default 0.152

## Placement (name value [footprint] x y rotation side)
J1  HDR-M-2.54_1x4  [HDR-M-2.54_1X4]  1.27 8.99 90 bottom
J2  HDR-M-2.54_1x3  [HDR-M-2.54_1X3]  45.72 5.11 90 bottom
J3  HDR-M-2.54_1x3  [HDR-M-2.54_1X3]  45.72 12.72 270 bottom
J6  HDR-M-2.54_1x4  [HDR-M-2.54_1X4]  15.24 1.49 0 top

## Footprints (pads in the part's own frame, mm; a bottom-side part is the same pattern mirrored in y, then rotated)
HDR-M-2.54_1X3
  rect 1.575x1.575 hole 0.889: 1(-2.54,0)
  round 1.575 hole 0.889: 2(0,0) 3(2.54,0)
HDR-M-2.54_1X4
  rect 1.575x1.575 hole 0.889: 1(-3.81,0)
  round 1.575 hole 0.889: 2(-1.27,0) 3(1.27,0) 4(3.81,0)

## Nets
3V3: J6.3 J6.4
12/24V: J3.3
12V: J3.1 J3.2
+5V: J1.3 J1.4
GND: J1.1 J1.2 J2.1 J2.2 J2.3 J6.1 J6.2

## Text on the board
Top Silkscreen Layer: GND*2 | 3V3*2 | 5V | GND | IN+ | IN- | L
